# Altium project 7000_0303_Rev13.PrjPcb (part 1 of 3)
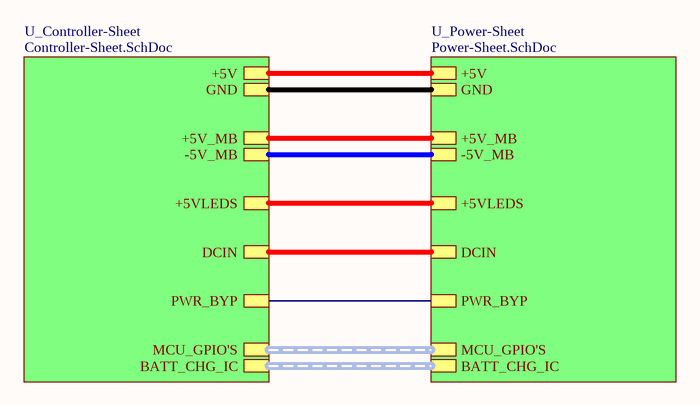
[diagram p0: Top-Sheet.SchDoc]
3 sheets, 124 parts. Net scope: hierarchical (ports join the sheet entries above them; power ports are global).
Board file: PCB_7000_0303_Rev13.PcbDoc
Sheets:
  Top-Sheet.SchDoc
    U_Controller-Sheet = Controller-Sheet.SchDoc
    U_Power-Sheet = Power-Sheet.SchDoc

## Sheet Top-Sheet.SchDoc
size A4; DocumentNumber: 1; SheetNumber: 1; SheetTotal: 3

### Sub-sheets
U_Controller-Sheet = Controller-Sheet.SchDoc: +5V, GND, +5V_MB, -5V_MB, +5VLEDS, DCIN, PWR_BYP, MCU_GPIO'S (harness MCU_GPIO'S), BATT_CHG_IC (harness BATT_CHG_IC)
U_Power-Sheet = Power-Sheet.SchDoc: +5V, GND, +5V_MB, -5V_MB, +5VLEDS, DCIN, PWR_BYP, MCU_GPIO'S (harness MCU_GPIO'S), BATT_CHG_IC (harness BATT_CHG_IC)

### Nets
+5V: sheet U_Controller-Sheet/+5V, sheet U_Power-Sheet/+5V
+5VLEDS: sheet U_Controller-Sheet/+5VLEDS, sheet U_Power-Sheet/+5VLEDS
GND: sheet U_Controller-Sheet/GND, sheet U_Power-Sheet/GND
+5V_MB: sheet U_Controller-Sheet/+5V_MB, sheet U_Power-Sheet/+5V_MB
-5V_MB: sheet U_Controller-Sheet/-5V_MB, sheet U_Power-Sheet/-5V_MB
DCIN: sheet U_Controller-Sheet/DCIN, sheet U_Power-Sheet/DCIN
PWR_BYP: sheet U_Controller-Sheet/PWR_BYP, sheet U_Power-Sheet/PWR_BYP

### Buses and harness runs
harness sheet U_Controller-Sheet/BATT_CHG_IC = sheet U_Power-Sheet/BATT_CHG_IC
harness sheet U_Controller-Sheet/MCU_GPIO'S = sheet U_Power-Sheet/MCU_GPIO'S

### Notes on the sheet
- File:
- Title:
- Date:
- Page
- Num:
- Total:
- Drawn By: Huzaifa Ali

## Sheet Controller-Sheet.SchDoc
size 420 x 297 mm; DocumentNumber: 3; SheetNumber: 3; SheetTotal: 3
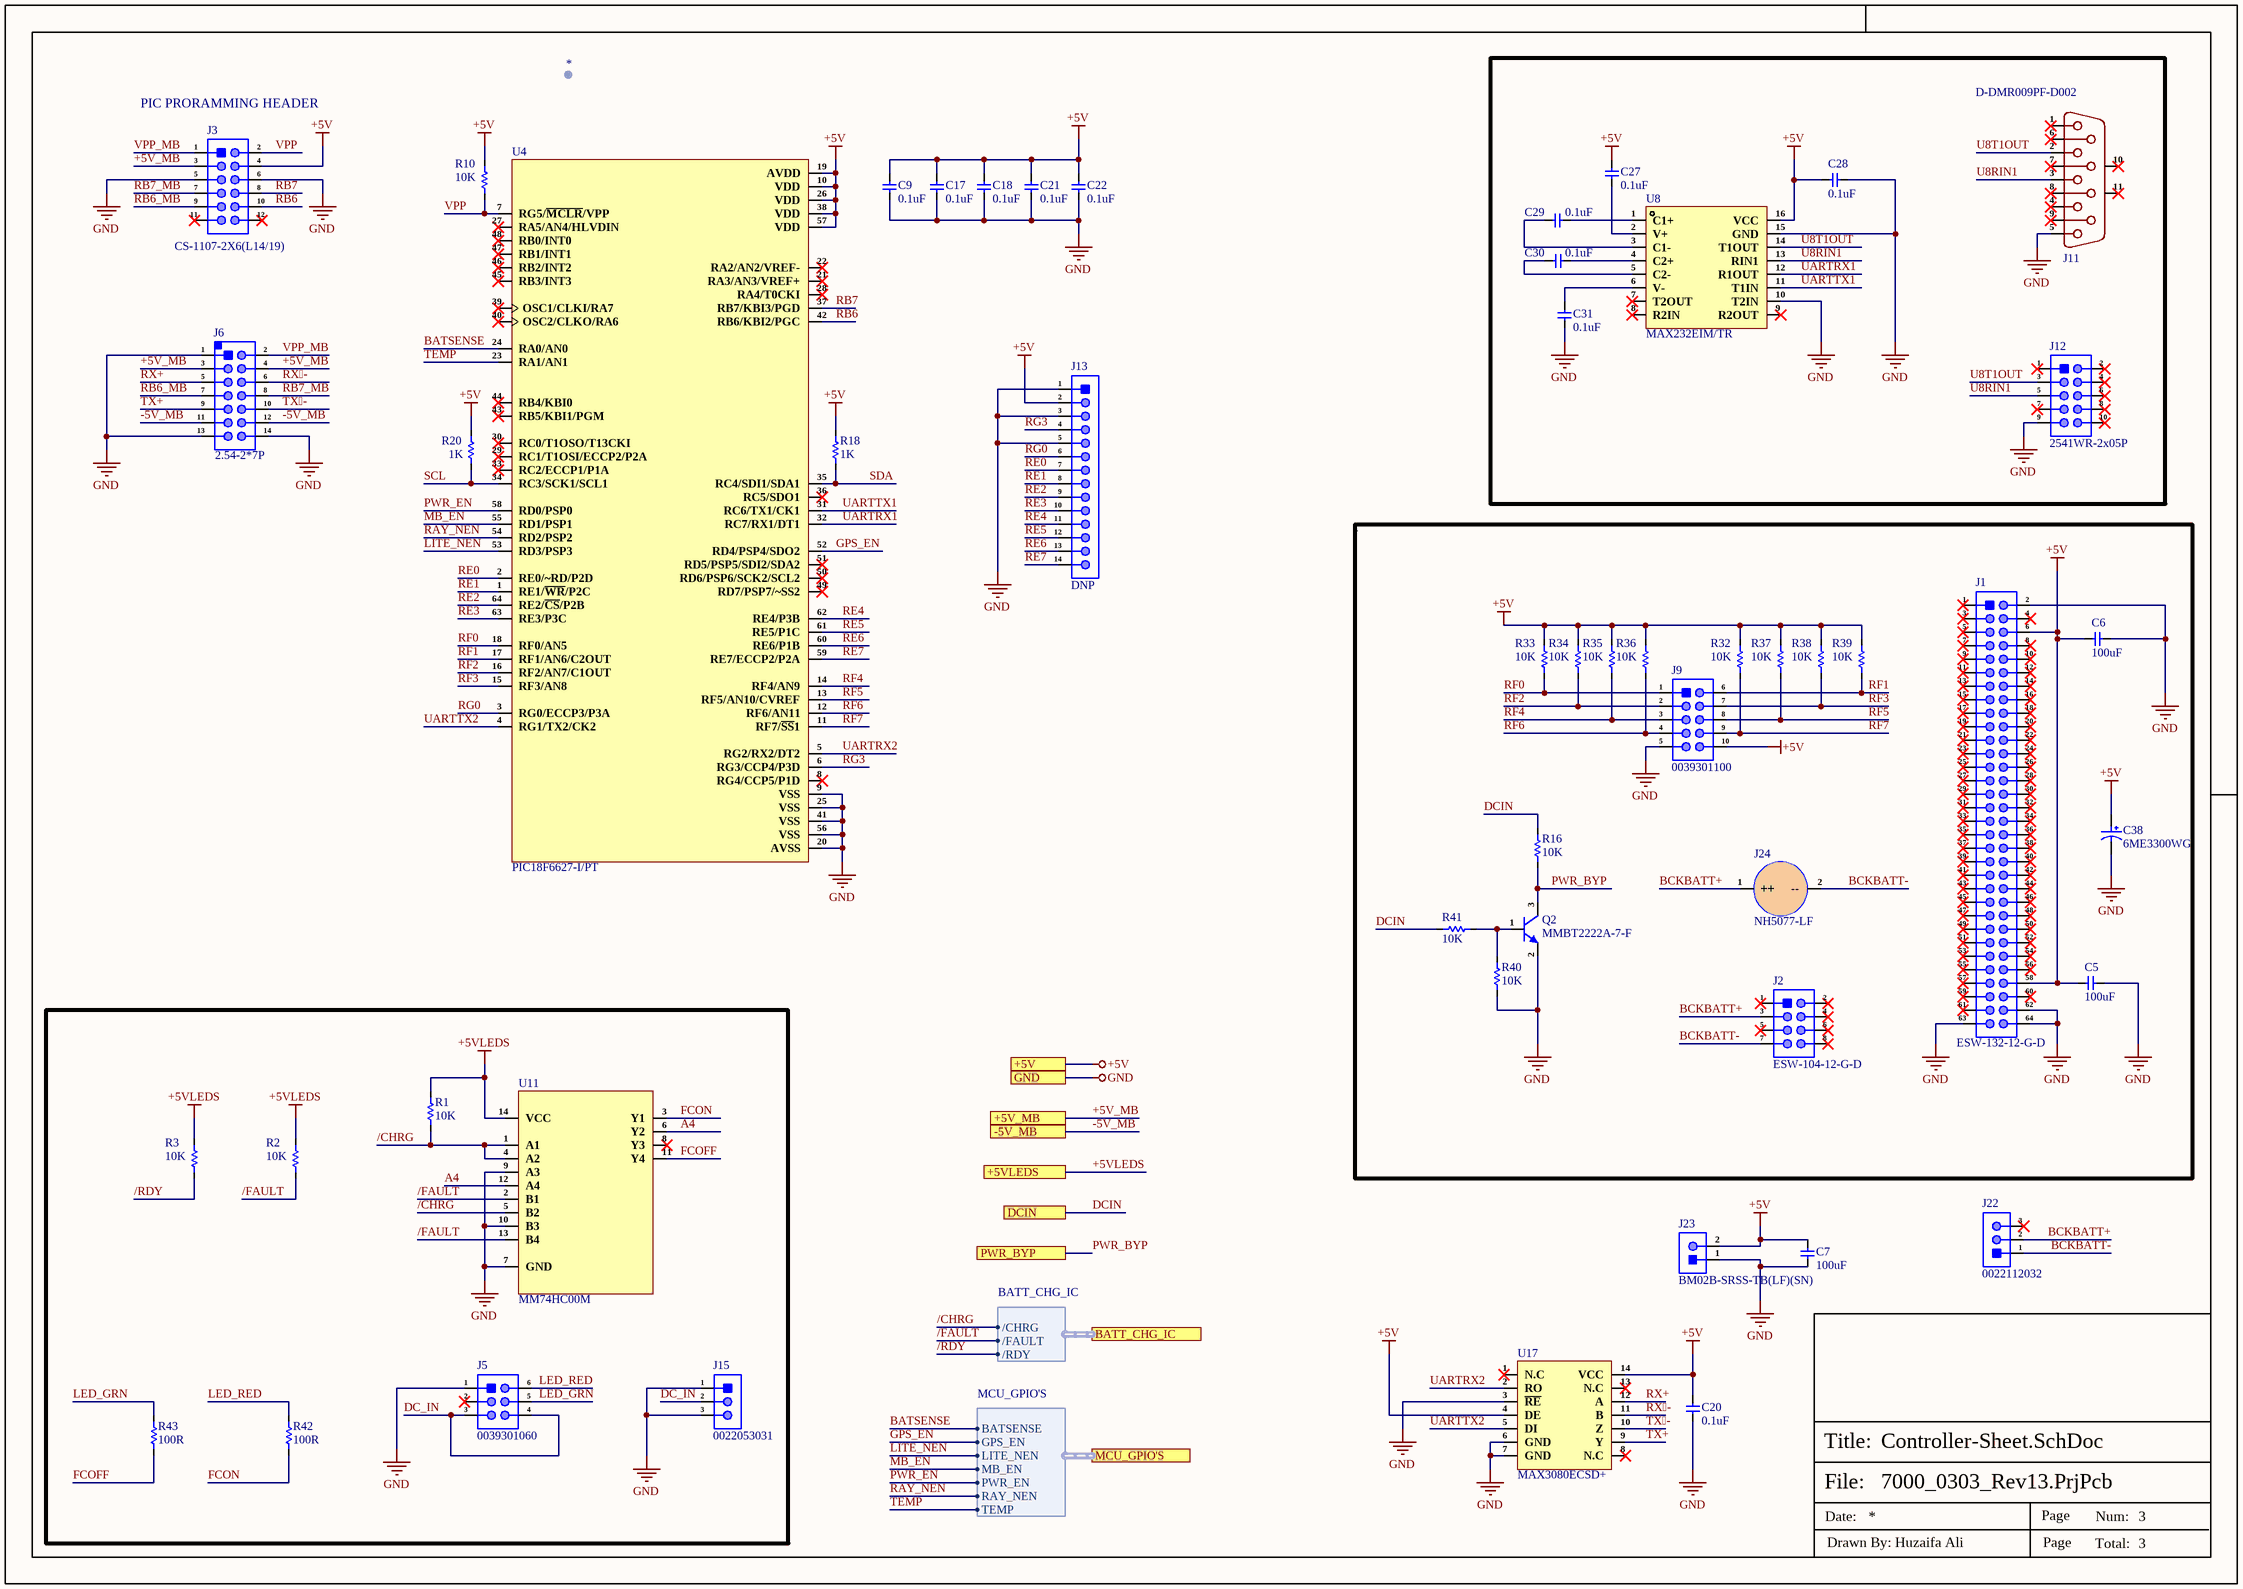
[diagram p1: Controller-Sheet.SchDoc]

### Parts
C5  100uF  [Cap-1210]
C6  100uF  [Cap-1210]
C7  100uF  [Cap-1210]
C9  0.1uF  [Cap-0603]
C17  0.1uF  [Cap-0603]
C18  0.1uF  [Cap-0603]
C20  0.1uF  [Cap-0603]
C21  0.1uF  [Cap-0603]
C22  0.1uF  [Cap-0603]
C27  0.1uF  [Cap-0603]
C28  0.1uF  [Cap-0603]
C29  0.1uF  [Cap-0603]
C30  0.1uF  [Cap-0603]
C31  0.1uF  [Cap-0603]
C38  6ME3300WG  [6ME3300WG]
J1  ESW-132-12-G-D  [ESW-132-12-G-D]
J2  ESW-104-12-G-D  [HDR 2x4 Female Header]
J3  CS-1107-2X6(L14/19)  [HDR 2x6TH (rigth angle)]
J5  0039301060  [0039301060]
J6  2.54-2*7P  [2.54-2*7P]
J9  0039301100  [0039301100]
J11  D-DMR009PF-D002  [D-DMR009PF-D002]
J12  2541WR-2x05P  [HDR 2x5TH (rigth angle)]
J13  DNP  [14P Through Hole Pads_]
J15  0022053031  [0022053031]
J22  0022112032  [0022112032]
J23  BM02B-SRSS-TB(LF)(SN)  [BM02B-SRSS-TB(LF)(SN)]
J24  NH5077-LF  [NH5077-LF]
Q2  MMBT2222A-7-F  [SOT-23]
R1  10K  [Res-0603]
R2  10K  [Res-0603]
R3  10K  [Res-0603]
R10  10K  [Res-0603]
R16  10K  [Res-0603]
R18  1K  [Res-0603]
R20  1K  [Res-0603]
R32  10K  [Res-0603]
R33  10K  [Res-0603]
R34  10K  [Res-0603]
R35  10K  [Res-0603]
R36  10K  [Res-0603]
R37  10K  [Res-0603]
R38  10K  [Res-0603]
R39  10K  [Res-0603]
R40  10K  [Res-0603]
R41  10K  [Res-0603]
R42  100R  [Res-0603]
R43  100R  [Res-0603]
U4  PIC18F6627-I/PT  [64-TQFP (10x10)]
U8  MAX232EIM/TR  [SOP-16]
U11  MM74HC00M  [SOIC-14]
U17  MAX3080ECSD+  [SOIC-14]

### Ports
+5V (see Top-Sheet[2B], Power-Sheet[1C]), +5V_MB (see Top-Sheet[2B], Power-Sheet[1C]), +5VLEDS (see Top-Sheet[2B], Power-Sheet[1C]), -5V_MB (see Top-Sheet[2B], Power-Sheet[1C]), BATT_CHG_IC (harness BATT_CHG_IC, see Top-Sheet[2C], Power-Sheet[1D]), DCIN (see Top-Sheet[2C], Power-Sheet[1D]), GND (see Top-Sheet[2B], Power-Sheet[1C]), MCU_GPIO'S (harness MCU_GPIO'S, see Top-Sheet[2C], Power-Sheet[1D]), PWR_BYP (see Top-Sheet[2C], Power-Sheet[1D])

### Harnesses
MCU_GPIO'S: BATSENSE, GPS_EN, LITE_NEN, MB_EN, PWR_EN, RAY_NEN, TEMP
BATT_CHG_IC: /CHRG, /FAULT, /RDY
*: 

### Nets
+5V: C5.1 C6.1 C7.2 C9.2 C17.2 C18.2 C20.2 C21.2 C22.2 C27.2 C28.2 C38.1 J1.6 J1.58 J3.4 J9.10 J13.2 J23.2 R10.1 R18.1 R20.2 R32.1 R33.1 R34.1 R35.1 R36.1 R37.1 R38.1 R39.1 U4.10(VDD) U4.19(AVDD) U4.26(VDD) U4.38(VDD) U4.57(VDD) U8.16(VCC) U17.4(DE) U17.14(VCC) ; port +5V
+5VLEDS: R1.2 R2.1 R3.1 U11.14(VCC) ; port +5VLEDS
GND: C5.2 C6.2 C7.1 C9.1 C17.1 C18.1 C20.1 C21.1 C22.1 C28.1 C31.1 C38.2 J1.2 J1.62 J1.63 J1.64 J3.5 J3.6 J5.1 J6.1 J6.13 J6.14 J9.5 J11.5 J12.9 J13.1 J13.3 J13.5 J15.1 J15.3 J23.1 Q2.2(E) R40.1 U4.9(VSS) U4.20(AVSS) U4.25(VSS) U4.41(VSS) U4.56(VSS) U8.10(T2IN) U8.15(GND) U11.7(GND) U11.9(A3) U11.10(B3) U17.3(~{RE}) U17.6(GND) U17.7(GND) ; port GND
+5V_MB: J3.3 J6.3 J6.4 ; port +5V_MB
-5V_MB: J6.11 J6.12 ; port -5V_MB
/CHRG: R1.1 U11.1(A1) U11.4(A2) U11.5(B2) ; port BATT_CHG_IC./CHRG
/FAULT: R2.2 U11.2(B1) U11.13(B4) ; port BATT_CHG_IC./FAULT
/RDY: R3.2 ; port BATT_CHG_IC./RDY
A4: U11.6(Y2) U11.12(A4)
BATSENSE: U4.24(RA0/AN0) ; port MCU_GPIO'S.BATSENSE
BCKBATT+: J2.3 J22.2 J24.1(++)
BCKBATT-: J2.7 J22.1 J24.2(--)
DC_IN: J5.3 J5.4 J15.2
DCIN: R16.2 R41.1 ; port DCIN
FCOFF: R43.1 U11.11(Y4)
FCON: R42.1 U11.3(Y1)
GPS_EN: U4.52(RD4/PSP4/SDO2) ; port MCU_GPIO'S.GPS_EN
LED_GRN: J5.5 R43.2
LED_RED: J5.6 R42.2
LITE_NEN: U4.53(RD3/PSP3) ; port MCU_GPIO'S.LITE_NEN
MB_EN: U4.55(RD1/PSP1) ; port MCU_GPIO'S.MB_EN
PWR_BYP: Q2.3(C) R16.1 ; port PWR_BYP
PWR_EN: U4.58(RD0/PSP0) ; port MCU_GPIO'S.PWR_EN
RAY_NEN: U4.54(RD2/PSP2) ; port MCU_GPIO'S.RAY_NEN
RB6: J3.10 U4.42(RB6/KBI2/PGC)
RB6_MB: J3.9 J6.7
RB7: J3.8 U4.37(RB7/KBI3/PGD)
RB7_MB: J3.7 J6.8
RE0: J13.7 U4.2(RE0/~RD/P2D)
RE1: J13.8 U4.1(RE1/~{WR}/P2C)
RE2: J13.9 U4.64(RE2/~{CS}/P2B)
RE3: J13.10 U4.63(RE3/P3C)
RE4: J13.11 U4.62(RE4/P3B)
RE5: J13.12 U4.61(RE5/P1C)
RE6: J13.13 U4.60(RE6/P1B)
RE7: J13.14 U4.59(RE7/ECCP2/P2A)
RF0: J9.1 R33.2 U4.18(RF0/AN5)
RF1: J9.6 R39.2 U4.17(RF1/AN6/C2OUT)
RF2: J9.2 R34.2 U4.16(RF2/AN7/C1OUT)
RF3: J9.7 R38.2 U4.15(RF3/AN8)
RF4: J9.3 R35.2 U4.14(RF4/AN9)
RF5: J9.8 R37.2 U4.13(RF5/AN10/CVREF)
RF6: J9.4 R36.2 U4.12(RF6/AN11)
RF7: J9.9 R32.2 U4.11(RF7/~{SS}1)
RG0: J13.6 U4.3(RG0/ECCP3/P3A)
RG3: J13.4 U4.6(RG3/CCP4/P3D)
RX-: J6.6 U17.11(B)
RX+: J6.5 U17.12(A)
SCL: R20.1 U4.34(RC3/SCK1/SCL1)
SDA: R18.2 U4.35(RC4/SDI1/SDA1)
TEMP: U4.23(RA1/AN1) ; port MCU_GPIO'S.TEMP
TX-: J6.10 U17.10(Z)
TX+: J6.9 U17.9(Y)
U8RIN1: J11.3 J12.5 U8.13(RIN1)
U8T1OUT: J11.2 J12.3 U8.14(T1OUT)
UARTRX1: U4.32(RC7/RX1/DT1) U8.12(R1OUT)
UARTRX2: U4.5(RG2/RX2/DT2) U17.2(RO)
UARTTX1: U4.31(RC6/TX1/CK1) U8.11(T1IN)
UARTTX2: U4.4(RG1/TX2/CK2) U17.5(DI)
VPP: J3.2 R10.2 U4.7(RG5/~{MCLR}/VPP)
VPP_MB: J3.1 J6.2
NetC27_1: C27.1 U8.2(V+)
NetC29_1: C29.1 U8.3(C1-)
NetC29_2: C29.2 U8.1(C1+)
NetC30_1: C30.1 U8.4(C2+)
NetC30_2: C30.2 U8.5(C2-)
NetC31_2: C31.2 U8.6(V-)
NetQ2_1: Q2.1(B) R40.2 R41.2

Not connected (* = marked no-connect by the designer): J1 1* 3* 4* 5* 7* 8* 9* 10* 11* 12* 13* 14* 15* 16* 17* 18* 19* 20* 21* 22* 23* 24* 25* 26* 27* 28* 29* 30* 31* 32* 33* 34* 35* 36* 37* 38* 39* 40* 41* 42* 43* 44* 45* 46* 47* 48* 49* 50* 51* 52* 53* 54* 55* 56* 57* 59* 60* 61*; J2 1* 2* 4* 5* 6* 8*; J3 11* 12*; J5 2*; J11 1* 4* 6* 7* 8* 9* 10(MH1)* 11(MH2)*; J12 1* 2* 4* 6* 7* 8* 10*; J22 3*; U4 8(RG4/CCP5/P1D)* 21(RA3/AN3/VREF+)* 22(RA2/AN2/VREF-)* 27(RA5/AN4/HLVDIN)* 28(RA4/T0CKI)* 29(RC1/T1OSI/ECCP2/P2A)* 30(RC0/T1OSO/T13CKI)* 33(RC2/ECCP1/P1A)* 36(RC5/SDO1)* 39(OSC1/CLKI/RA7)* 40(OSC2/CLKO/RA6)* 43(RB5/KBI1/PGM)* 44(RB4/KBI0)* 45(RB3/INT3)* 46(RB2/INT2)* 47(RB1/INT1)* 48(RB0/INT0)* 49(RD7/PSP7/~SS2)* 50(RD6/PSP6/SCK2/SCL2)* 51(RD5/PSP5/SDI2/SDA2)*; U8 7(T2OUT)* 8(R2IN)* 9(R2OUT)*; U11 8(Y3)*; U17 1(N.C)* 8(N.C)* 13(N.C)*

### Notes on the sheet
- (near J3) PIC PRORAMMING HEADER
- File:
- Title:
- Date:
- Page
- Num:
- Total:
- Drawn By: Huzaifa Ali

### Library data of the parts
C5-C7 = EMK325ABJ107MM-P: CAP CER 100UF 16V X5R 1210; Manufacturer: Taiyo Yuden; Tolerance: 20%; Item Type: Capacitor; Supplier 1: Digi-Key; Manufacturer Part Number: EMK325ABJ107MM-P; RoHS: Yes; Category: Ceramic Capacitors; Stock 1: 81344; Pricing 1: 1=1.75, 10=1.415, 50=1.2352, 100=1.0809, 500=0.82352 (USD); Mounting Technology: Surface Mount; Case/Package: 1210; Case Code (Imperial): 1210; Case Code (Metric): 3225; Min Operating Temperature: -55°C; Max Operating Temperature: 85°C; Packaging: Cut Tape; Value: 100uF; Voltage Rating: 16V; Series: M; Lead Free: Lead Free; RoHS Compliant: Yes; ComponentLink1URL: http://ds.yuden.co.jp/TYCOMPAS/ut/detail.do?productNo=EMK325ABJ107MM-P&fileName=EMK325ABJ107MM-P_SS&mode=specSheetDownload&src-supplier=Digi-Key; ComponentLink1Description: http://ds.yuden.co.jp/TYCOMPAS/ut/detail.do?productNo=EMK325ABJ107MM-P&fileName=EMK325ABJ107MM-P_SS&mode=specSheetDownload&src-supplier=Digi-Key; Supplier Part Number 1: 587-5426-1-ND; LCSC Part Number: C90143
C9 C17 C18 C20-C22 C27-C31 = CC0603KRX7R0BB104: CAP CER 0.1UF 100V X7R 0603; Manufacturer: Yageo; Capacitance: 100nF; Tolerance: 10%; Item Type: Capacitor; Supplier 1: Digi-Key; Manufacturer Part Number: CC0603KRX7R0BB104; RoHS: Yes; Category: Ceramic Capacitors; Stock 1: 60476; Pricing 1: 1=0.19000, 10=0.13500, 50=0.07680, 100=0.06370, 500=0.04466, 1000=0.03696 (USD); Mount: Surface Mount; Case/Package: 0603; Case Code (Metric): 1608; Case Code (Imperial): 0603; Weight: 7.1E-05oz; Min Operating Temperature: -55°C; Max Operating Temperature: 125°C; Package Quantity: 4000; Voltage Rating: 100V; Packaging: Tape and Reel; Dielectric: X7R; Termination: SMD/SMT; Resistor Type: Ceramic; Voltage Rating (DC): 100V; Series: CC; Length: 0.063inch; Width: 0.031inch; Thickness: 0.035inch; Depth: 0.8mm; Lead Free: Lead Free; RoHS Compliant: Yes; ComponentLink1URL: https://datasheet.ciiva.com/6277/mlccorderingcode-6277030.pdf?src-supplier=Digi-Key; ComponentLink1Description: https://datasheet.ciiva.com/6277/mlccorderingcode-6277030.pdf?src-supplier=Digi-Key; ComponentLink2URL: https://datasheet.ciiva.com/6277/mlccorderingcode-6277081.pdf?src-supplier=Digi-Key; ComponentLink2Description: https://datasheet.ciiva.com/6277/mlccorderingcode-6277081.pdf?src-supplier=Digi-Key; ComponentLink3URL: https://datasheet.ciiva.com/6277/mlccorderingcode-6277082.pdf?src-supplier=Digi-Key; ComponentLink3Description: https://datasheet.ciiva.com/6277/mlccorderingcode-6277082.pdf?src-supplier=Digi-Key; Supplier Part Number 1: 311-1523-1-ND; LCSC Part Number: C113803
C38 = 6ME3300WG: 3300uF 6.3V ±20% Plugin,D10xL23mm Aluminum Electrolytic Capacitors - Leaded ROHS; Manufacturer: SUNCON(SUN Elec Industries); Manufacturer Part Number: 6ME3300WG; Package: Plugin,D10xL23mm; LCSC Part Number: C242095; Item Type: Capacitors; ComponentLink1Description: LCSC; ComponentLink1URL: https://www.lcsc.com/product-detail/Aluminum-Electrolytic-Capacitors-Leaded_SUNCON-SUN-Elec-Industries-6ME3300WG_C242095.html
J1 = ESW-132-12-G-D: CONN SOCKET 64POS 0.1 GOLD PCB; Manufacturer: Samtec; Item Type: Connectors; Number of Contacts: 64; Gender: Receptacle; Max Current Rating: 6.9A; Contact Resistance: 10mR; Max Voltage Rating (AC): 550V; Pitch: 2.54mm; Row Spacing: 0.1inch; Supplier: Digikey; Supplier Part Number: SAM10471-ND; Manufacturer Part Number: ESW-132-12-G-D; RoHS: Yes; Stock: 450; Pricing: 1=14.7, 10=12.736, 100=10.4968, 500=9.58712, 1000=9.228 (USD); Mounting Technology: Through Hole; Contact Plating: Gold; Contact Material: Bronze; Color: Black; Housing Color: Black; Housing Material: Polyester; Contact Finish - Mating: GOLD; Insulation Color: Black; Insulation Material: Polymer; Contact Shape: Square; Min Operating Temperature: -55°C; Max Operating Temperature: 125°C; Number of Rows: 2; Termination: Solder; Packaging: Rail/Tube; Package Quantity: 1; Connector Type: Receptacle; Number of Positions: 64; Orientation: Straight; Series: ESW; Contact Type: Female Socket; Fastening Type: Pull; Voltage Rating (AC): 550V; Length: 81.79mm; Depth: 4.95mm; RoHS Compliant: Yes; Flammability Rating: UL94 V-0; ComponentLink1URL: https://datasheet.ciiva.com/756/esw-1xx-xx-x-x-xx-xx-mkt-756084.pdf?src-supplier=Digikey; ComponentLink1Description: https://datasheet.ciiva.com/756/esw-1xx-xx-x-x-xx-xx-mkt-756084.pdf?src-supplier=Digikey
J2 = ESW-104-12-G-D: Battery Holder Vertical; Manufacturer: Samtec; Connector Type: Receptacle; Number of Positions: 8; Gender: Female; Max Current Rating: 6.9A; Max Voltage Rating (AC): 550V; Contact Resistance: 10mR; Pitch: 2.54mm; Row Spacing: 0.1inch; Item Type: Female Header; Supplier: Digikey; Supplier Part Number: SAM10466-ND; Manufacturer Part Number: ESW-104-12-G-D; RoHS: Yes; Category: Connectors; Stock: 332; Pricing: 1=3.41, 10=3.095, 100=2.727, 500=2.31796, 1000=1.97708, 5000=1.77255 (USD); Mounting Technology: Through Hole; Contact Plating: Gold; Contact Material: Bronze; Contact Finish - Mating: GOLD; Insulation Color: Black; Insulation Material: Polymer; Contact Shape: Square; Housing Color: Black; Housing Material: Polyester; Color: Black; Min Operating Temperature: -55°C; Max Operating Temperature: 125°C; Number of Rows: 2; Packaging: Rail/Tube; Termination: Solder; Number of Contacts: 8; Series: ESW; Contact Type: Female Socket; Fastening Type: Pull; Orientation: Vertical; Package Quantity: 1; Voltage Rating (AC): 550V; Length: 10.67mm; Depth: 4.95mm; Radiation Hardening: No; RoHS Compliant: Yes; Flammability Rating: UL94 V-0; ComponentLink1URL: https://datasheet.ciiva.com/756/esw-1xx-xx-x-x-xx-xx-mkt-756054.pdf?src-supplier=Digikey; ComponentLink1Description: https://datasheet.ciiva.com/756/esw-1xx-xx-x-x-xx-xx-mkt-756054.pdf?src-supplier=Digikey; ComponentLink2URL: https://datasheet.ciiva.com/16990/nh5077-lf-16990158.pdf?src-supplier=Future+Electronics; ComponentLink2Description: https://datasheet.ciiva.com/16990/nh5077-lf-16990158.pdf?src-supplier=Future+Electronics; ComponentLink3URL: https://datasheet.ciiva.com/1391/35241-1391061.pdf?src-supplier=Element14; ComponentLink3Description: https://datasheet.ciiva.com/1391/35241-1391061.pdf?src-supplier=Element14; ComponentLink4URL: https://datasheet.ciiva.com/12342/nh5077-lf-29240-12342970.pdf?src-supplier=Mouser; ComponentLink4Description: https://datasheet.ciiva.com/12342/nh5077-lf-29240-12342970.pdf?src-supplier=Mouser
J3 = CS-1107-2X6(L14/19): 250V 3A Right-Angle Square Pins 2.54mm 12P 6mm -40℃~+105℃ 2.54mm 双排 Black 2x6P 2.54mm Push-Pull,P=2.54mm Pin Headers ROHS; Manufacturer: CST; Manufacturer Part Number: CS-1107-2X6(L14/19); Package: Push-Pull,P=2.54mm; LCSC Part Number: C2911299; Item Type: Pin Header; ComponentLink1Description: LCSC; ComponentLink1URL: https://www.lcsc.com/product-detail/Pin-Headers_CST-CS-1107-2X6-L14-19_C2911299.html
J5 = 0039301060: CONN HEADER R/A 6POS 4.2MM; Manufacturer: Molex; Item Type: Headers, Male Pins; Supplier: Mouser; Supplier Part Number: 538-39-30-1060; Manufacturer Part Number: 0039301060; RoHS: Yes; Stock: 9943; Pricing: 1=1.12, 10=0.953, 50=0.953, 100=0.856, 1000=0.7, 10000=0.545 (USD)
J6 = 2.54-2*7P: 2.54mm Straight 2x7P 7 Horn buckle 2.54mm 2 Plugin,P=2.54mm IDC Connectors ROHS; Manufacturer: BOOMELE; Manufacturer Part Number: 2.54-2*7P; Package: Plugin,P=2.54mm; LCSC Part Number: C9037; Item Type: IDC Connectors; ComponentLink1Description: LCSC; ComponentLink1URL: https://www.lcsc.com/product-detail/IDC-Connectors_BOOMELE-Boom-Precision-Elec-2-54-2-7P_C9037.html
J9 = 0039301100: CONN HEADER R/A 10POS 4.2MM; Manufacturer: Molex; Item Type: Wire To Board Connector; Supplier: Mouser; Supplier Part Number: 538-39-30-1100; Manufacturer Part Number: 0039301100; RoHS: Yes; Stock: 6491; Pricing: 1=1.3, 10=1.06, 50=1.06, 100=0.929, 1000=0.864, 10000=0.724 (USD); ComponentLink1URL: http://components.arrow.com/part/dataview/4710462S3155547N3303?src-supplier=Arrow+Electronics; ComponentLink1Description: http://components.arrow.com/part/dataview/4710462S3155547N3303?src-supplier=Arrow+Electronics; ComponentLink2URL: https://datasheet.octopart.com/39-30-1100-Molex-datasheet-143353.pdf?src-supplier=Digikey; ComponentLink2Description: https://datasheet.octopart.com/39-30-1100-Molex-datasheet-143353.pdf?src-supplier=Digikey; ComponentLink3URL: http://www.molex.com/webdocs/datasheets/pdf/en-us/0039301100_PCB_HEADERS.pdf?src-supplier=Avnet; ComponentLink3Description: http://www.molex.com/webdocs/datasheets/pdf/en-us/0039301100_PCB_HEADERS.pdf?src-supplier=Avnet; LCSC Part Number: C504987
J11 = D-DMR009PF-D002: 9P Female D-Sub Right-Angle 2 3A -50℃~+105℃ Push-Pull D-Sub / VGA connector ROHS; Manufacturer: Ckmtw; Manufacturer Part Number: D-DMR009PF-D002; Package: Push-Pull; LCSC Part Number: C141882; Item Type: VGA connector; ComponentLink1Description: LCSC; ComponentLink1URL: https://www.lcsc.com/product-detail/D-Sub-VGA-connector_Ckmtw-Shenzhen-Cankemeng-D-DMR009PF-D002_C141882.html
J12 = 2541WR-2x05P: Right-Angle 2.5mm 6mm 10P 2.54mm 双排 2x5P Plugin,P=2.54mm Pin Headers ROHS; Manufacturer: HanElectricity; Manufacturer Part Number: 2541WR-2x05P; Package: Plugin,P=2.54mm; LCSC Part Number: C5383090; Item Type: Pin Header; ComponentLink1Description: LCSC; ComponentLink1URL: https://www.lcsc.com/product-detail/Pin-Headers_HanElectricity-2541WR-2x05P_C5383090.html
J13 = 14P Through Hole Pads: Wire Connecting Pads; Manufacturer Part Number: 14P Through Hole Pads; Item Type: Through Hole Pads
J15 = 0022053031: CONN HEADER R/A 3POS 2.54MM; Manufacturer: Molex; Item Type: Headers, Male Pins; Supplier: Mouser; Supplier Part Number: 538-22-05-3031; Manufacturer Part Number: 0022053031; RoHS: Yes; Stock: 22393; Pricing: 1=0.48, 10=0.423, 50=0.423, 100=0.349, 1000=0.25, 10000=0.205 (USD)
J22 = 0022112032: CONN HEADER VERT 3POS 2.54MM; Manufacturer: Molex; Item Type: Headers, Male Pins; Supplier: Mouser; Supplier Part Number: 538-22-11-2032; Manufacturer Part Number: 0022112032; RoHS: Yes; Stock: 32037; Pricing: 1=0.68, 10=0.599, 50=0.599, 100=0.494, 1000=0.354, 10000=0.311 (USD); ComponentLink1URL: https://www.molex.com/pdm_docs/sd/022112032_sd.pdf?src-supplier=Digikey; ComponentLink1Description: https://www.molex.com/pdm_docs/sd/022112032_sd.pdf?src-supplier=Digikey; LCSC Part Number: C505163
J23 = BM02B-SRSS-TB(LF)(SN): CONN HEADER SMD 2POS 1MM; Manufacturer: JST; Item Type: Connectors; Gender: 29Gender; Supplier: Future Electronics; Supplier Part Number: 9104290; Manufacturer Part Number: BM02B-SRSS-TB(LF)(SN); RoHS: Yes; Stock: 597; Pricing: 1=0.198 (USD); Housing Color: 50Colour; Housing Material: 4261ConductorMaterial; Orientation: 5495OrientationType; Lead Free: 5697LeadFree; ComponentLink1URL: https://datasheet.ciiva.com/8052/91630-8052077.pdf?src-supplier=Element14; ComponentLink1Description: https://datasheet.ciiva.com/8052/91630-8052077.pdf?src-supplier=Element14; ComponentLink2URL: https://datasheet.ciiva.com/16351/bm02b-srss-tb-lf-sn-16351949.pdf?src-supplier=Future+Electronics; ComponentLink2Description: https://datasheet.ciiva.com/16351/bm02b-srss-tb-lf-sn-16351949.pdf?src-supplier=Future+Electronics; LCSC Part Number: C160388
J24 = NH5077-LF: Coin Cell Battery Holders VERT HOLDER FOR OR CR2477N; Manufacturer: Renata; Item Type: Batteries and Accessories; Supplier: Future Electronics; Supplier Part Number: 3698206; Manufacturer Part Number: NH5077-LF; RoHS: Yes; Stock: 477; Pricing: 50=1.72, 200=1.68, 750=1.63, 1500=1.61, 3750=1.56 (USD); ComponentLink1URL: https://datasheet.ciiva.com/16990/nh5077-lf-16990158.pdf?src-supplier=Future+Electronics; ComponentLink1Description: https://datasheet.ciiva.com/16990/nh5077-lf-16990158.pdf?src-supplier=Future+Electronics; ComponentLink2URL: https://datasheet.ciiva.com/1391/35241-1391061.pdf?src-supplier=Element14; ComponentLink2Description: https://datasheet.ciiva.com/1391/35241-1391061.pdf?src-supplier=Element14; ComponentLink3URL: https://datasheet.ciiva.com/12342/nh5077-lf-29240-12342970.pdf?src-supplier=Mouser; ComponentLink3Description: https://datasheet.ciiva.com/12342/nh5077-lf-29240-12342970.pdf?src-supplier=Mouser
Q2 = MMBT2222A-7-F: TRANS NPN 40V 0.6A SMD SOT23-3; Manufacturer: Diodes; Max Power Dissipation: 300mW; Collector Base Voltage (VCBO): 75V; Max Collector Current: 600mA; hFE Min: 100; Frequency: 300MHz; Number of Elements: 1; Emitter Base Voltage (VEBO): 6V; Collector Emitter Saturation Voltage: 1V; Power Dissipation: 350mW; Element Configuration: Single; Current: 1A; Item Type: Mosfet; Supplier 1: Digi-Key; Manufacturer Part Number: MMBT2222A-7-F; Stock 1: 2471182; Pricing 1: 1=0.15, 10=0.134, 100=0.0729, 500=0.04486, 1000=0.03059 (USD); Mount: Surface Mount; Case/Package: SOT-23; Number of Pins: 3; Weight: 0.000282oz; Contact Plating: Matte,Tin; Min Operating Temperature: -55°C; Max Operating Temperature: 150°C; Packaging: Tape and Reel; Collector Emitter Voltage (VCEO): 40V; Polarity: NPN; Voltage Rating (DC): 40V; Package Quantity: 3000; Continuous Collector Current: 600mA; Collector Emitter Breakdown Voltage: 40V; Transition Frequency: 300MHz; Max Breakdown Voltage: 40V; Max Frequency: 300MHz; Termination: SMD/SMT; Gain Bandwidth Product: 300MHz; Current Rating: 600mA; Voltage: 40V; Length: 3.05mm; Height: 1mm; Width: 1.4mm; Radiation Hardening: No; Lead Free: Lead Free; REACH SVHC: No SVHC; ComponentLink1URL: http://www.diodes.com/datasheets/ds30041.pdf?src-supplier=Future+Electronics; ComponentLink1Description: http://www.diodes.com/datasheets/ds30041.pdf?src-supplier=Future+Electronics; ComponentLink2URL: http://www.diodes.com/datasheets/ds30041.pdf?src-supplier=Avnet; ComponentLink2Description: http://www.diodes.com/datasheets/ds30041.pdf?src-supplier=Avnet; ComponentLink3URL: https://www.verical.com/server-webapp/html/getDatasheet?partID=82692&src-supplier=Verical; ComponentLink3Description: https://www.verical.com/server-webapp/html/getDatasheet?partID=82692&src-supplier=Verical; ComponentLink4URL: https://www.diodes.com/assets/Datasheets/ds30041.pdf?src-supplier=Digi-Key; ComponentLink4Description: https://www.diodes.com/assets/Datasheets/ds30041.pdf?src-supplier=Digi-Key; ComponentLink5URL: http://www.diodes.com/datasheets/ds30041.pdf?src-supplier=Avnet+Europe; ComponentLink5Description: http://www.diodes.com/datasheets/ds30041.pdf?src-supplier=Avnet+Europe; ComponentLink6URL: http://www.diodes.com/datasheets/ds30041.pdf?src-supplier=Element14; ComponentLink6Description: http://www.diodes.com/datasheets/ds30041.pdf?src-supplier=Element14; Supplier Part Number 1: MMBT2222A-FDIDKR-ND; LCSC Part Number: C94515
R1-R3 R10 R16 R32-R41 = RT0603BRD0710KL: RES SMD 10K OHM 0.1% 1/10W 0603; Manufacturer: Yageo; Power: 100mW; Rated Temperature: 70°C; Value: 10kR; Temperature Coefficient: 25ppm/°C; Working Voltage: 75V; Package Height: 0.45mm; Package Length: 1.6mm; Package Width: 0.8mm; Item Type: Resistor; Supplier 1: Rs; Manufacturer Part Number: RT0603BRD0710KL; RoHS: Yes; Category: Chip SMD Resistors; Stock 1: 20510; Pricing 1: 100=0.29800, 250=0.27800, 500=0.25900, 1000=0.23700 (GBP); Mounting Technology: Surface Mount; Pins: 2; Case/Package: 0603; Min Operating Temperature: -55°C; Max Operating Temperature: 155°C; Tolerance: 0.1%; Resistor Type: FIXED RESISTOR; Construction: Chip; Package Style: SMTMeter; Packaging: Tape and Reel; Technology: THIN FILM; Termination: Wraparound; Reach SVHC Compliant: Yes; RoHS Compliant: Yes; ComponentLink1URL: https://datasheet.ciiva.com:443/pdfs/VipMasterIC/IC/YAGO/YAGO-S-A0008510989/YAGO-S-A0008510989-1.pdf?src-supplier=IHS+Markit; ComponentLink1Description: https://datasheet.ciiva.com:443/pdfs/VipMasterIC/IC/YAGO/YAGO-S-A0008510989/YAGO-S-A0008510989-1.pdf?src-supplier=IHS+Markit; ComponentLink2URL: https://datasheet.ciiva.com/5624/pyu-rt-1-to-0-05-rohs-l-4-5624351.pdf?src-supplier=Mouser; ComponentLink2Description: https://datasheet.ciiva.com/5624/pyu-rt-1-to-0-05-rohs-l-4-5624351.pdf?src-supplier=Mouser; ComponentLink3URL: https://datasheet.ciiva.com/29721/pyu-rt-1-to-0-05-rohs-l-4-29721177.pdf?src-supplier=Digi-Key; ComponentLink3Description: https://datasheet.ciiva.com/29721/pyu-rt-1-to-0-05-rohs-l-4-29721177.pdf?src-supplier=Digi-Key; Supplier Part Number 1: 1991391P; LCSC Part Number: C95204
R18 R20 = RC0603FR-071KL: RES SMD 1K OHM 1% 1/10W 0603; Manufacturer: Yageo; Resistance: 1kR; Temperature Coefficient: 100ppm/°C; Power Rating: 100mW; Voltage Rating: 50V; Item type: Resistor; ComponentLink1URL: https://www.verical.com/server-webapp/html/getDatasheet?partID=409289&src-supplier=Verical; ComponentLink1Description: https://www.verical.com/server-webapp/html/getDatasheet?partID=409289&src-supplier=Verical; Supplier 1: Digi-Key; Manufacturer Part Number: RC0603FR-071KL; Stock 1: 21472395; Pricing 1: 1=0.1, 10=0.023, 100=0.0094, 1000=0.0042, 2500=0.0037 (USD); Case/Package: 0603; Contact Plating: Tin,Matte; Case Code (Imperial): 0603; Case Code (Metric): 1608; Min Operating Temperature: -55°C; Max Operating Temperature: 155°C; Tolerance: 1%; Composition: Thick Film; Packaging: Tape and Reel; Termination: SMD/SMT; Military Standard: Not; Length: 1.6mm; Height: 0.45mm; Depth: 0.8mm; Radiation Hardening: No; REACH SVHC: No SVHC; Lead Free: Lead Free; ComponentLink2URL: http://documents.rs-components.com/techlib://itc_doclist_GB.htm?stockno=5048928&src-supplier=RSComponents; ComponentLink2Description: http://documents.rs-components.com/techlib://itc_doclist_GB.htm?stockno=5048928&src-supplier=RSComponents; ComponentLink3URL: http://www.yageo.com/documents/recent/PYu-RC0603_51_RoHS_L_4.pdf?src-supplier=Avnet+Europe; ComponentLink3Description: http://www.yageo.com/documents/recent/PYu-RC0603_51_RoHS_L_4.pdf?src-supplier=Avnet+Europe; ComponentLink4URL: http://www.farnell.com/datasheets/2167052.pdf?src-supplier=Element14; ComponentLink4Description: http://www.farnell.com/datasheets/2167052.pdf?src-supplier=Element14; ComponentLink5URL: http://www.farnell.com/datasheets/1868787.pdf?src-supplier=Element14; ComponentLink5Description: http://www.farnell.com/datasheets/1868787.pdf?src-supplier=Element14; ComponentLink6URL: http://www.yageo.com/documents/recent/PYu-RC_Group_51_RoHS_L_2.pdf?src-supplier=Avnet; ComponentLink6Description: http://www.yageo.com/documents/recent/PYu-RC_Group_51_RoHS_L_2.pdf?src-supplier=Avnet; ComponentLink7URL: https://www.verical.com/server-webapp/html/getDatasheet?partID=404327&src-supplier=Verical; ComponentLink7Description: https://www.verical.com/server-webapp/html/getDatasheet?partID=404327&src-supplier=Verical; ComponentLink8URL: http://www.farnell.com/datasheets/443971.pdf?src-supplier=Element14; ComponentLink8Description: http://www.farnell.com/datasheets/443971.pdf?src-supplier=Element14; Supplier Part Number 1: 311-1.00KHRDKR-ND; LCSC Part Number: C22548
R42 R43 = RC0603FR-07100RL: RES SMD 100 OHM 1% 1/10W 0603; Manufacturer: Yageo; Temperature Coefficient: 100ppm/°C; Voltage Rating (DC): 50V; Power Rating: 100mW; Item Type: Resistor; Supplier 1: Arrow Electronics; Manufacturer Part Number: RC0603FR-07100RL; RoHS: Yes; Category: Chip SMD Resistors; Stock 1: 3800000; Pricing 1: 5000=0.00300, 5000=0.00200, 5000=0.00450, 50000=0.00410, 500000=0.00230, 2500000=0.00140 (USD); Case/Package: 0603; Number of Pins: 2; Case Code (Imperial): 0603; Case Code (Metric): 1608; Size Code: 0603; Min Operating Temperature: -55°C; Max Operating Temperature: 155°C; Resistance: 100R; Tolerance: 1%; Resistor Type: Thick Film; Packaging: Tape and Reel; Voltage Rating: 50V; Termination: SMD/SMT; Features: Moisture Resistant; Series: RC; Max Power Dissipation: 100mW; Number of Terminations: 2; Construction: Rectangular; Resistance Tolerance: 1%; Technology: THICK FILM; Length: 1.6mm; Width: 0.8mm; Height: 0.45mm; Depth: 0.8mm; REACH SVHC: Unknown; Lead Free: Lead Free; RoHS Compliant: Yes; Military Standard: Not; Supplier Part Number 1: RC0603FR-07100RL; LCSC Part Number: C105588
U4 = PIC18F6627-I/PT: IC MCU 8BIT 96KB FLASH 64TQFP; Manufacturer: Microchip; Supplier: Digikey; Supplier Part Number: PIC18F6627-I/PT-ND; Manufacturer Part Number: PIC18F6627-I/PT; RoHS: Yes; Item Type: IC; Stock: 1660; Pricing: 1=11.3 (USD); ComponentLink1URL: https://datasheet.ciiva.com/7774/39646c-7774478.pdf?src-supplier=Element14; ComponentLink1Description: https://datasheet.ciiva.com/7774/39646c-7774478.pdf?src-supplier=Element14; ComponentLink2URL: https://datasheet.ciiva.com/7774/39646c-7774479.pdf?src-supplier=Element14; ComponentLink2Description: https://datasheet.ciiva.com/7774/39646c-7774479.pdf?src-supplier=Element14; ComponentLink3URL: https://datasheet.ciiva.com/9236/39646c-9236634.pdf?src-supplier=Avnet; ComponentLink3Description: https://datasheet.ciiva.com/9236/39646c-9236634.pdf?src-supplier=Avnet; ComponentLink4URL: https://datasheet.ciiva.com/6132/62310-6132869.pdf?src-supplier=Farnell; ComponentLink4Description: https://datasheet.ciiva.com/6132/62310-6132869.pdf?src-supplier=Farnell; ComponentLink5URL: https://datasheet.ciiva.com/6132/652299-6132870.pdf?src-supplier=Farnell; ComponentLink5Description: https://datasheet.ciiva.com/6132/652299-6132870.pdf?src-supplier=Farnell; ComponentLink6URL: https://datasheet.ciiva.com/41453/001084362-da-01-en-ic-pic-mcu-f-pic18f6627-i-pt-tqfp-64-mcp-41453830.pdf?src-supplier=Conrad; ComponentLink6Description: https://datasheet.ciiva.com/41453/001084362-da-01-en-ic-pic-mcu-f-pic18f6627-i-pt-tqfp-64-mcp-41453830.pdf?src-supplier=Conrad
U8 = MAX232EIM/TR: 140Kbps transceiver SOP-16 RS232 ICs ROHS; Manufacturer: HGSEMI; Item Type: IC; Manufacturer Part Number: MAX232EIM/TR; Package: SOP-16; LCSC Part Number: C519083; ComponentLink1Description: LCSC; ComponentLink1URL: https://www.lcsc.com/product-detail/RS-span-style-background-color-ff0-232-span-ICs_HGSEMI-MAX232EIM-TR_C519083.html
U11 = MM74HC00M: IC GATE NAND 4CH 2-INP 14SOIC; Manufacturer: ON Semiconductor / Fairchild; Number of Gates: 4; Propagation Delay: 15ns; Max Supply Voltage: 6V; Min Supply Voltage: 2V; Low Level Output Current: 5.2mA; High Level Output Current: -5.2mA; Logic Function: NAND GATE; Number of Outputs: 1; Number of Inputs: 2; Quiescent Current: 2uA; Turn-On Delay Time: 90ns; Voltage: 5V; Operating Supply Voltage: 2.5V; Supplier: Avnet; Supplier Part Number: MM74HC00M; Manufacturer Part Number: MM74HC00M; RoHS: Yes; Item Type: IC; Stock: 5775; Pricing: 3847=0.1924, 3900=0.1872, 7700=0.182, 20000=0.1768, 39000=0.1716, 200000=0.1664, 390000=0.1612 (USD); Mounting Technology: Surface Mount; Case/Package: SOIC; Pins: 14; Min Operating Temperature: -40°C; Max Operating Temperature: 85°C; Packaging: Rail/Tube; Number of Circuits: 4; Series: 74HC; Output Current: 5.2mA; Number of Elements: 4; Technology: CMOS; Channels: 4; Nominal Supply Voltage: 6V; Length: 8.75mm; Width: 4mm; Height: 1.5mm; Radiation Hardening: No; RoHS Compliant: Yes; Lead Free: Lead Free; Reach SVHC Compliant: No; ComponentLink1URL: https://datasheet.ciiva.com/14100/mbmm74hc00-dat-en-14100074.pdf?src-supplier=Distrelec; ComponentLink1Description: https://datasheet.ciiva.com/14100/mbmm74hc00-dat-en-14100074.pdf?src-supplier=Distrelec; ComponentLink2URL: https://datasheet.ciiva.com/19477/786200-19477374.pdf?src-supplier=Jameco; ComponentLink2Description: https://datasheet.ciiva.com/19477/786200-19477374.pdf?src-supplier=Jameco; ComponentLink3URL: https://datasheet.ciiva.com/15090/getdatasheetpartid-44431-15090201.pdf?src-supplier=Verical; ComponentLink3Description: https://datasheet.ciiva.com/15090/getdatasheetpartid-44431-15090201.pdf?src-supplier=Verical; ComponentLink4URL: https://datasheet.ciiva.com/8248/mm74hc00-8248959.pdf?src-supplier=Avnet; ComponentLink4Description: https://datasheet.ciiva.com/8248/mm74hc00-8248959.pdf?src-supplier=Avnet; ComponentLink5URL: https://datasheet.ciiva.com/1862/mm74hc00-1862378.pdf?src-supplier=Digikey; ComponentLink5Description: https://datasheet.ciiva.com/1862/mm74hc00-1862378.pdf?src-supplier=Digikey
U17 = MAX3080ECSD+: IC TRANSCEIVER FULL 1/1 14SOIC; Manufacturer: Maxim; Supplier: Mouser; Supplier Part Number: 700-MAX3080ECSD; Manufacturer Part Number: MAX3080ECSD+; RoHS: Yes; Item Type: IC; Stock: 531; Pricing: 1=5.09, 10=4.32, 50=4.32, 100=3.74, 1000=2.68, 10000=2.55 (USD); ComponentLink1URL: https://datasheet.ciiva.com/3028/max3080e-max3089e-3028432.pdf?src-supplier=Avnet; ComponentLink1Description: https://datasheet.ciiva.com/3028/max3080e-max3089e-3028432.pdf?src-supplier=Avnet; ComponentLink2URL: https://datasheet.ciiva.com/30478/0900766b811dea3c-30478288.pdf?src-supplier=Rs; ComponentLink2Description: https://datasheet.ciiva.com/30478/0900766b811dea3c-30478288.pdf?src-supplier=Rs; ComponentLink3URL: https://datasheet.ciiva.com/14429/max3080e-max3089e-14429944.pdf?src-supplier=Avnet; ComponentLink3Description: https://datasheet.ciiva.com/14429/max3080e-max3089e-14429944.pdf?src-supplier=Avnet; ComponentLink4URL: https://datasheet.ciiva.com/1712/max3080e-max3089e-1712792.pdf?src-supplier=Digikey; ComponentLink4Description: https://datasheet.ciiva.com/1712/max3080e-max3089e-1712792.pdf?src-supplier=Digikey; ComponentLink5URL: https://datasheet.ciiva.com/1503/74602-1503433.pdf?src-supplier=Element14; ComponentLink5Description: https://datasheet.ciiva.com/1503/74602-1503433.pdf?src-supplier=Element14

## Sheet Power-Sheet.SchDoc
size 420 x 297 mm; DocumentNumber: 2; SheetNumber: 2; SheetTotal: 3
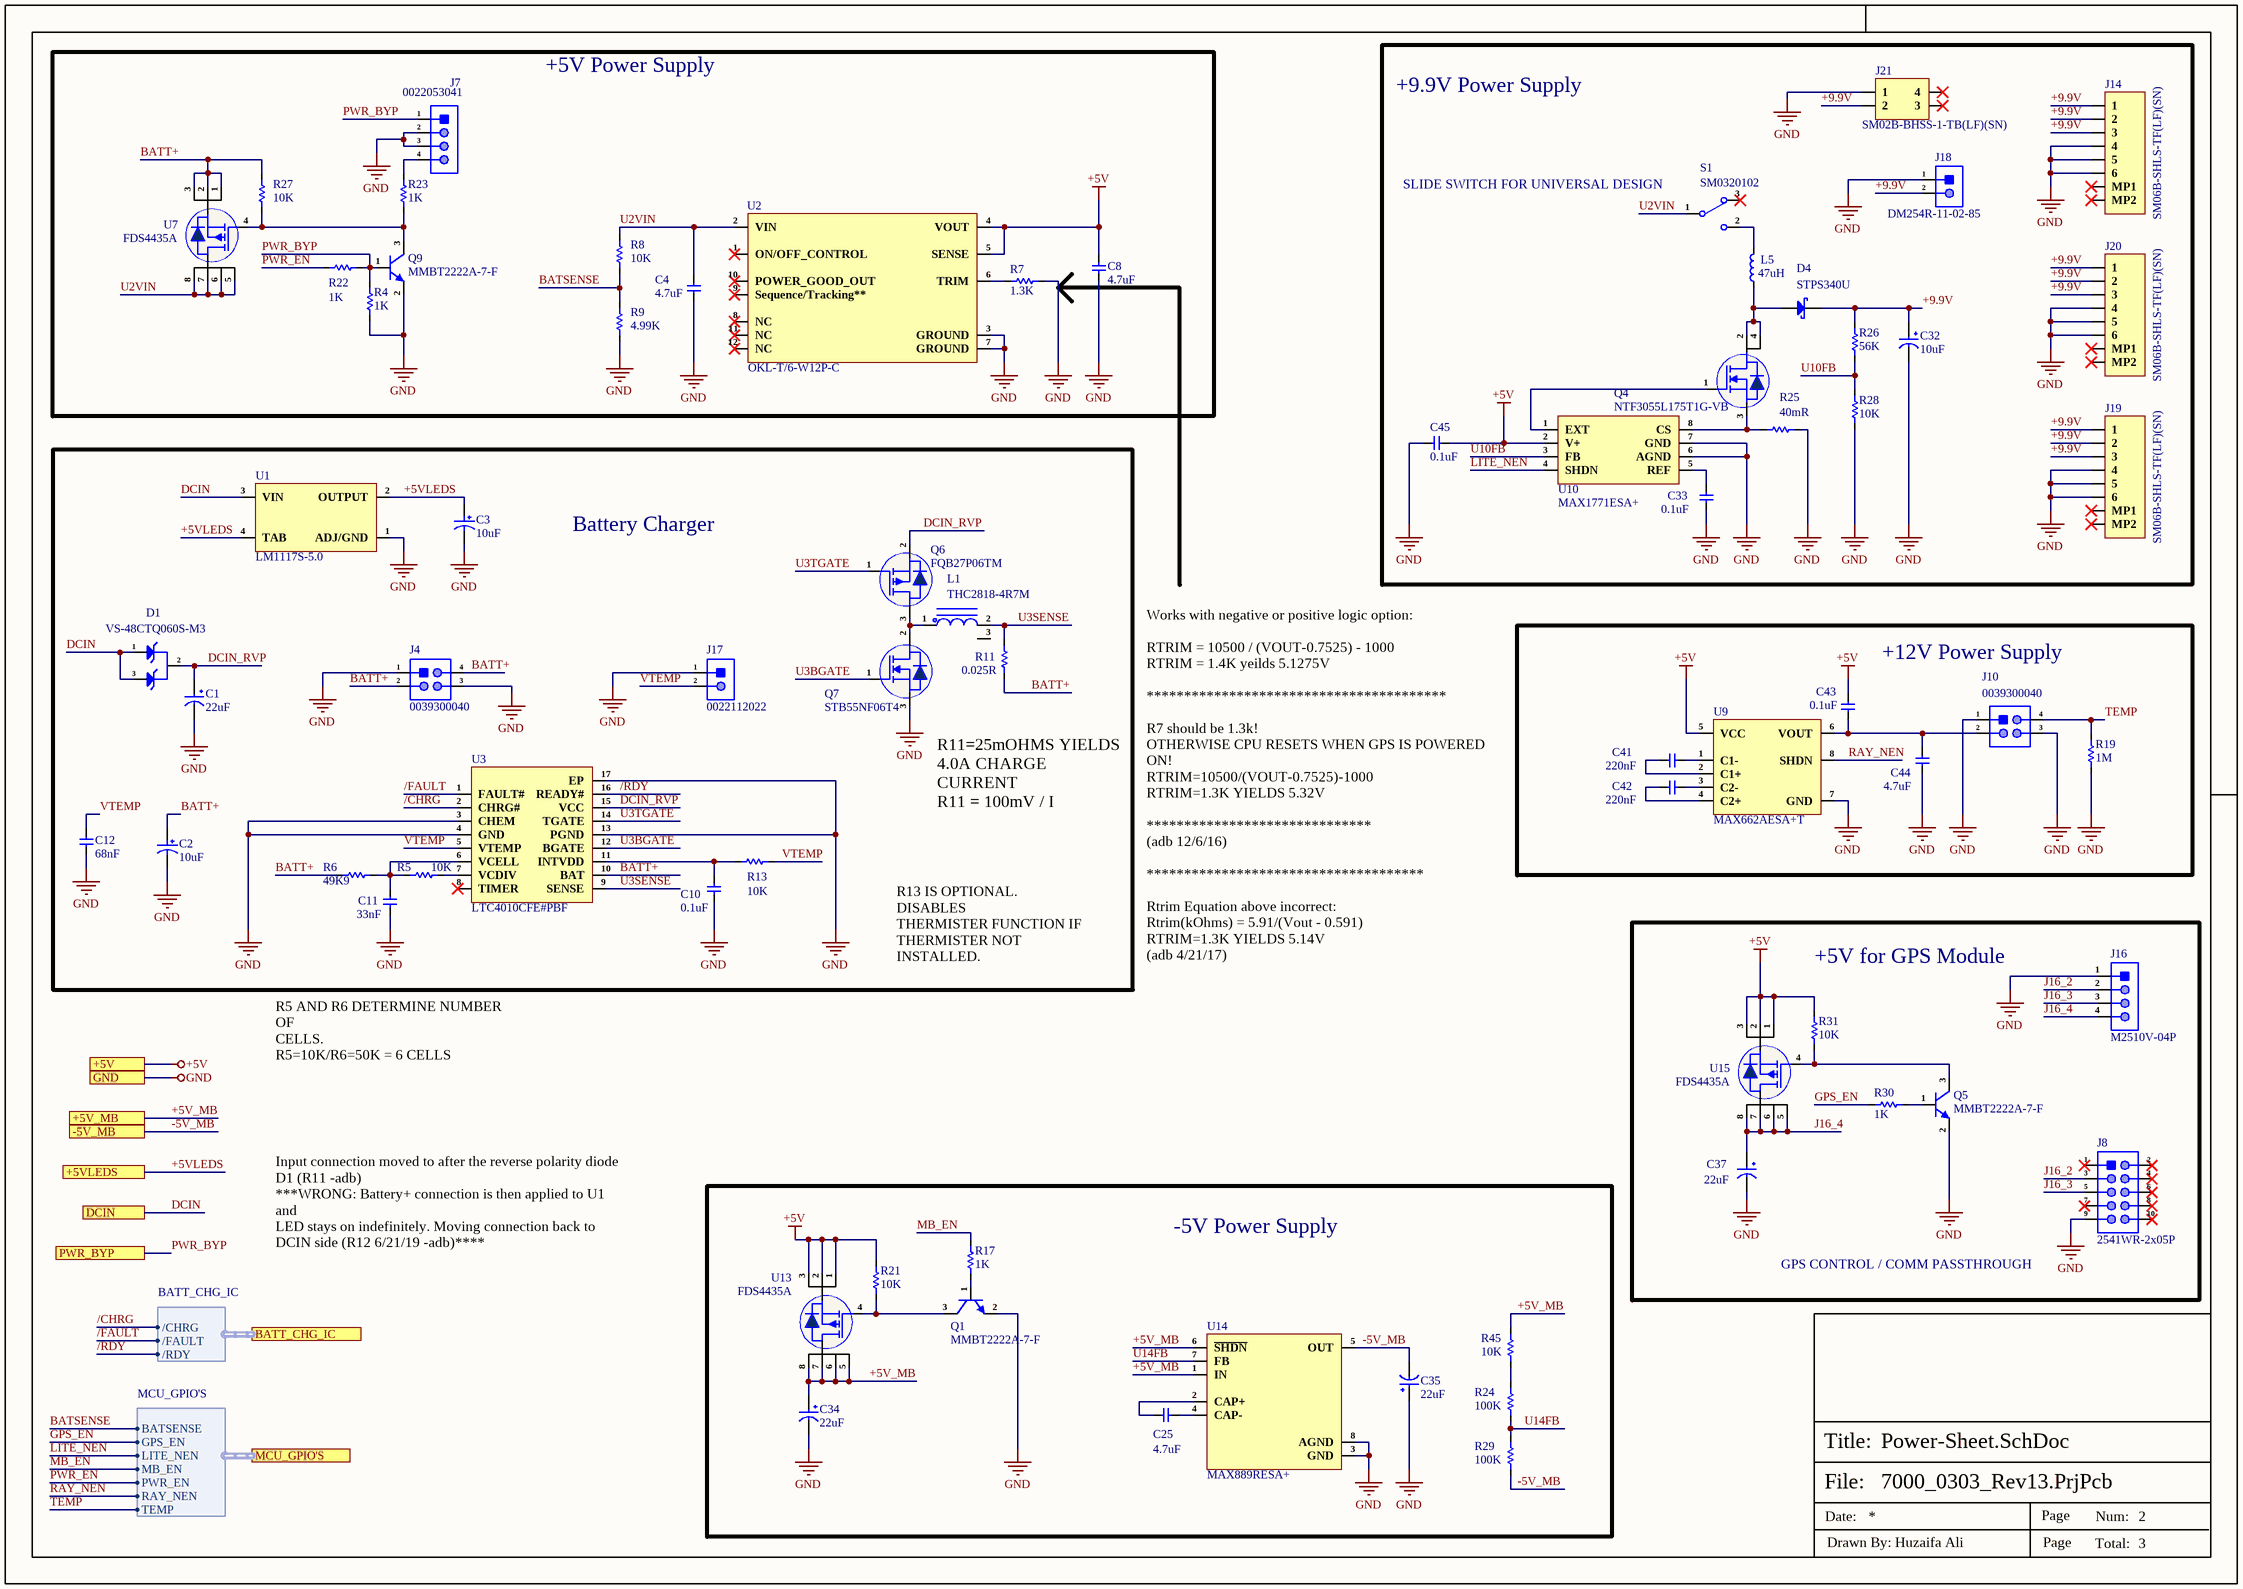
[diagram p2: Power-Sheet.SchDoc]

### Parts
C1  22uF  [Case-C]
C2  10uF  [Case-B]
C3  10uF  [Case-B]
C4  4.7uF  [Cap-0603]
C8  4.7uF  [Cap-0603]
C10  0.1uF  [Cap-0603]
C11  33nF  [Cap-0603]
C12  68nF  [Cap-0603]
C25  4.7uF  [Cap-0603]
C32  10uF  [Case-C]
C33  0.1uF  [Cap-0603]
C34  22uF  [Case-B]
C35  22uF  [Case-B]
C37  22uF  [Case-B]
C41  220nF  [Cap-0603]
C42  220nF  [Cap-0603]
C43  0.1uF  [Cap-0603]
C44  4.7uF  [Cap-0603]
C45  0.1uF  [Cap-0603]
D1  VS-48CTQ060S-M3  [VS-48CTQ060S-M3]
D4  STPS340U  [SMB_]
J4  0039300040  [0039300040]
J7  0022053041  [0022053041]
J8  2541WR-2x05P  [HDR 2x5TH (rigth angle)]
J10  0039300040  [0039300040]
J14  SM06B-SHLS-TF(LF)(SN)  [SM06B-SHLS-TF(LF)(SN)]
J16  M2510V-04P  [M2510V-04P]
J17  0022112022  [0022112022]
J18  DM254R-11-02-85  [HDR1X2 (Female)]
J19  SM06B-SHLS-TF(LF)(SN)  [SM06B-SHLS-TF(LF)(SN)]
J20  SM06B-SHLS-TF(LF)(SN)  [SM06B-SHLS-TF(LF)(SN)]
J21  SM02B-BHSS-1-TB(LF)(SN)  [SM02B-BHSS-1-TB(LF)(SN)]
L1  THC2818-4R7M  [THC2818-4R7M]
L5  47uH  [SMMS1050-470M]
Q1  MMBT2222A-7-F  [SOT-23]
Q4  NTF3055L175T1G-VB  [SOT- 223]
Q5  MMBT2222A-7-F  [SOT-23]
Q6  FQB27P06TM  [D2Pak.]
Q7  STB55NF06T4  [STB55NF06T4]
Q9  MMBT2222A-7-F  [SOT-23]
R4  1K  [Res-0603]
R5  10K  [Res-0603]
R6  49K9  [Res-0603]
R7  1.3K  [Res-0603]
R8  10K  [Res-0603]
R9  4.99K  [Res-0603]
R11  0.025R  [RES-2512]
R13  10K  [Res-0603]
R17  1K  [Res-0603]
R19  1M  [Res-0603]
R21  10K  [Res-0603]
R22  1K  [Res-0603]
R23  1K  [Res-0603]
R24  100K  [Res-0603]
R25  40mR  [Res-1206]
R26  56K  [Res-0603]
R27  10K  [Res-0603]
R28  10K  [Res-0603]
R29  100K  [Res-0603]
R30  1K  [Res-0603]
R31  10K  [Res-0603]
R45  10K  [Res-0603]
S1  SM0320102  [SM0320102]
U1  LM1117S-5.0  [SOT- 223]
U2  OKL-T/6-W12P-C  [OKL-T/6-W12P-C]  (value not drawn)
U3  LTC4010CFE#PBF  [TSSOP-16-EP]
U7  FDS4435A  [SOIC-8]
U9  MAX662AESA+T  [SOIC-8(0.154", 3.90mm Width)]
U10  MAX1771ESA+  [SOIC-8(0.150", 3.80mm Width)]
U13  FDS4435A  [SOIC-8]
U14  MAX889RESA+  [SOIC-8(0.154", 3.90mm Width)]
U15  FDS4435A  [SOIC-8]

### Blocks framed on the sheet
+5V Power Supply: C4 C8 J7 Q9 R4 R7-R9 R22 R23 R27 U2 U7
+9.9V Power Supply: C32 C33 C45 D4 J14 J18-J21 L5 Q4 R25 R26 R28 S1 U10
Battery Charger: C1-C3 C10-C12 D1 J4 J17 L1 Q6 Q7 R5 R6 R11 R13 U1 U3
+12V Power Supply: C41-C44 J10 R19 U9
+5V for GPS Module: C37 J8 J16 Q5 R30 R31 U15
-5V Power Supply: C25 C34 C35 Q1 R17 R21 R24 R29 R45 U13 U14

### Ports
+5V (see Top-Sheet[3B], Controller-Sheet[3C]), +5V_MB (see Top-Sheet[3B], Controller-Sheet[3C]), +5VLEDS (see Top-Sheet[3B], Controller-Sheet[3C]), -5V_MB (see Top-Sheet[3B], Controller-Sheet[3C]), BATT_CHG_IC (harness BATT_CHG_IC, see Top-Sheet[3C], Controller-Sheet[3D]), DCIN (see Top-Sheet[3C], Controller-Sheet[3D]), GND (see Top-Sheet[3B], Controller-Sheet[3C]), MCU_GPIO'S (harness MCU_GPIO'S, see Top-Sheet[3C], Controller-Sheet[3D]), PWR_BYP (see Top-Sheet[3C], Controller-Sheet[3D])

### Harnesses
MCU_GPIO'S: BATSENSE, GPS_EN, LITE_NEN, MB_EN, PWR_EN, RAY_NEN, TEMP
BATT_CHG_IC: /CHRG, /FAULT, /RDY

### Nets
+5V: C8.2 C43.2 C45.1 R21.2 R31.2 U2.4(VOUT) U2.5(SENSE) U9.5(VCC) U10.2(V+) U13.1(S) U13.2(S) U13.3(S) U15.1(S) U15.2(S) U15.3(S) ; port +5V
+5VLEDS: C3.1 U1.2(OUTPUT) U1.4(TAB) ; port +5VLEDS
GND: C1.2 C2.2 C3.2 C4.1 C8.1 C10.1 C11.2 C12.1 C32.2 C33.1 C34.2 C35.1 C37.2 C44.1 C45.2 J4.1 J4.3 J7.2 J7.3 J8.9 J10.1 J10.3 J14.4 J14.5 J14.6 J16.1 J17.1 J18.1 J19.4 J19.5 J19.6 J20.4 J20.5 J20.6 J21.1 Q1.2(E) Q5.2(E) Q7.3(S) Q9.2(E) R4.2 R7.1 R9.1 R19.1 R25.1 R28.1 U1.1(ADJ/GND) U2.3(GROUND) U2.7(GROUND) U3.3(CHEM) U3.4(GND) U3.13(PGND) U3.17(EP) U9.7(GND) U10.6(AGND) U10.7(GND) U14.3(GND) U14.8(AGND) ; port GND
+5V_MB: C34.1 R45.2 U13.5(D) U13.6(D) U13.7(D) U13.8(D) U14.1(IN) U14.6(~{SHDN}) ; port +5V_MB
+9.9V: C32.1 D4.2(K) J14.1 J14.2 J14.3 J18.2 J19.1 J19.2 J19.3 J20.1 J20.2 J20.3 J21.2 R26.2
-5V_MB: C35.2 R29.1 U14.5(OUT) ; port -5V_MB
/CHRG: U3.2(CHRG#) ; port BATT_CHG_IC./CHRG
/FAULT: U3.1(FAULT#) ; port BATT_CHG_IC./FAULT
/RDY: U3.16(READY#) ; port BATT_CHG_IC./RDY
BATSENSE: R8.2 R9.2 ; port MCU_GPIO'S.BATSENSE
BATT+: C2.1 J4.2 J4.4 R6.1 R11.1 R27.1 U3.10(BAT) U7.1(S) U7.2(S) U7.3(S)
DCIN: D1.1(ANODE) D1.3(ANODE) U1.3(VIN) ; port DCIN
DCIN_RVP: C1.1 D1.2(CATHODE) Q6.2(S) U3.15(VCC)
GPS_EN: R30.2 ; port MCU_GPIO'S.GPS_EN
J16_2: J8.3 J16.2
J16_3: J8.5 J16.3
J16_4: C37.1 J16.4 U15.5(D) U15.6(D) U15.7(D) U15.8(D)
LITE_NEN: U10.4(SHDN) ; port MCU_GPIO'S.LITE_NEN
MB_EN: R17.2 ; port MCU_GPIO'S.MB_EN
PWR_BYP: J7.1 Q9.1(B) R4.1 R22.1 ; port PWR_BYP
PWR_EN: R22.2 ; port MCU_GPIO'S.PWR_EN
RAY_NEN: U9.8(SHDN) ; port MCU_GPIO'S.RAY_NEN
TEMP: J10.4 R19.2 ; port MCU_GPIO'S.TEMP
U2VIN: C4.2 R8.1 S1.1 U2.2(VIN) U7.5(D) U7.6(D) U7.7(D) U7.8(D)
U3BGATE: Q7.1(G) U3.12(BGATE)
U3SENSE: L1.2 R11.2 U3.9(SENSE)
U3TGATE: Q6.1(G) U3.14(TGATE)
U10FB: R26.1 R28.2 U10.3(FB)
U14FB: R24.1 R29.2 U14.7(FB)
VTEMP: C12.2 J17.2 R13.2 U3.5(VTEMP)
NetC10_2: C10.2 R13.1 U3.11(INTVDD)
NetC11_1: C11.1 R5.1 R6.2 U3.6(VCELL)
NetC25_1: C25.1 U14.2(CAP+)
NetC25_2: C25.2 U14.4(CAP-)
NetC33_2: C33.2 U10.5(REF)
NetC41_1: C41.1 U9.2(C1+)
NetC41_2: C41.2 U9.1(C1-)
NetC42_1: C42.1 U9.4(C2+)
NetC42_2: C42.2 U9.3(C2-)
NetC43_1: C43.1 C44.2 J10.2 U9.6(VOUT)
NetD4_1: D4.1(A) L5.1 Q4.2(D) Q4.4(D)
NetJ7_4: J7.4 R23.1
NetL1_1: L1.1 Q6.3(D) Q7.2(D)
NetL5_2: L5.2 S1.2
NetQ1_1: Q1.1(B) R17.1
NetQ1_3: Q1.3(C) R21.1 U13.4(G)
NetQ4_1: Q4.1(G) U10.1(EXT)
NetQ4_3: Q4.3(S) R25.2 U10.8(CS)
NetQ5_1: Q5.1(B) R30.1
NetQ5_3: Q5.3(C) R31.1 U15.4(G)
NetQ9_3: Q9.3(C) R23.2 R27.2 U7.4(G)
NetR5_2: R5.2 U3.7(VCDIV)
NetR7_2: R7.2 U2.6(TRIM)
NetR24_2: R24.2 R45.1

Not connected (* = marked no-connect by the designer): J8 1* 2* 4* 6* 7* 8* 10*; J14 MP1* MP2*; J19 MP1* MP2*; J20 MP1* MP2*; J21 3* 4*; L1 3; S1 3*; U2 1(ON/OFF_CONTROL)* 8(NC)* 9(Sequence/Tracking**)* 10(POWER_GOOD_OUT)* 11(NC)* 12(NC)*; U3 8(TIMER)*

### Notes on the sheet
- SLIDE SWITCH FOR UNIVERSAL DESIGN
- R11=25mOHMS YIELDS 4.0A CHARGE CURRENT
  R11 = 100mV / I
- R13 IS OPTIONAL. DISABLES
  THERMISTER FUNCTION IF
  THERMISTER NOT INSTALLED.
  THERMISTER - 10K NTC / B=3750
- Works with negative or positive logic option:
  RTRIM = 10500 / (VOUT-0.7525) - 1000
  RTRIM = 1.4K yeilds 5.1275V
  ****************************************
  R7 should be 1.3k!
  OTHERWISE CPU RESETS WHEN GPS IS POWERED ON!
  RTRIM=10500/(VOUT-0.7525)-1000
  RTRIM=1.3K YIELDS 5.32V
  ******************************
  (adb 12/6/16)
  *************************************
  Rtrim Equation above incorrect:
  Rtrim(kOhms) = 5.91/(Vout - 0.591)
  RTRIM=1.3K YIELDS 5.14V
  (adb 4/21/17)
- R5 AND R6 DETERMINE NUMBER OF
  CELLS.
  R5=10K/R6=50K = 6 CELLS
- GPS CONTROL / COMM PASSTHROUGH
- Input connection moved to after the reverse polarity diode D1 (R11 -adb)
  ***WRONG: Battery+ connection is then applied to U1 and
  LED stays on indefinitely. Moving connection back to DCIN side (R12 6/21/19 -adb)****
- File:
- Title:
- Date:
- Page
- Num:
- Total:
- Drawn By: Huzaifa Ali